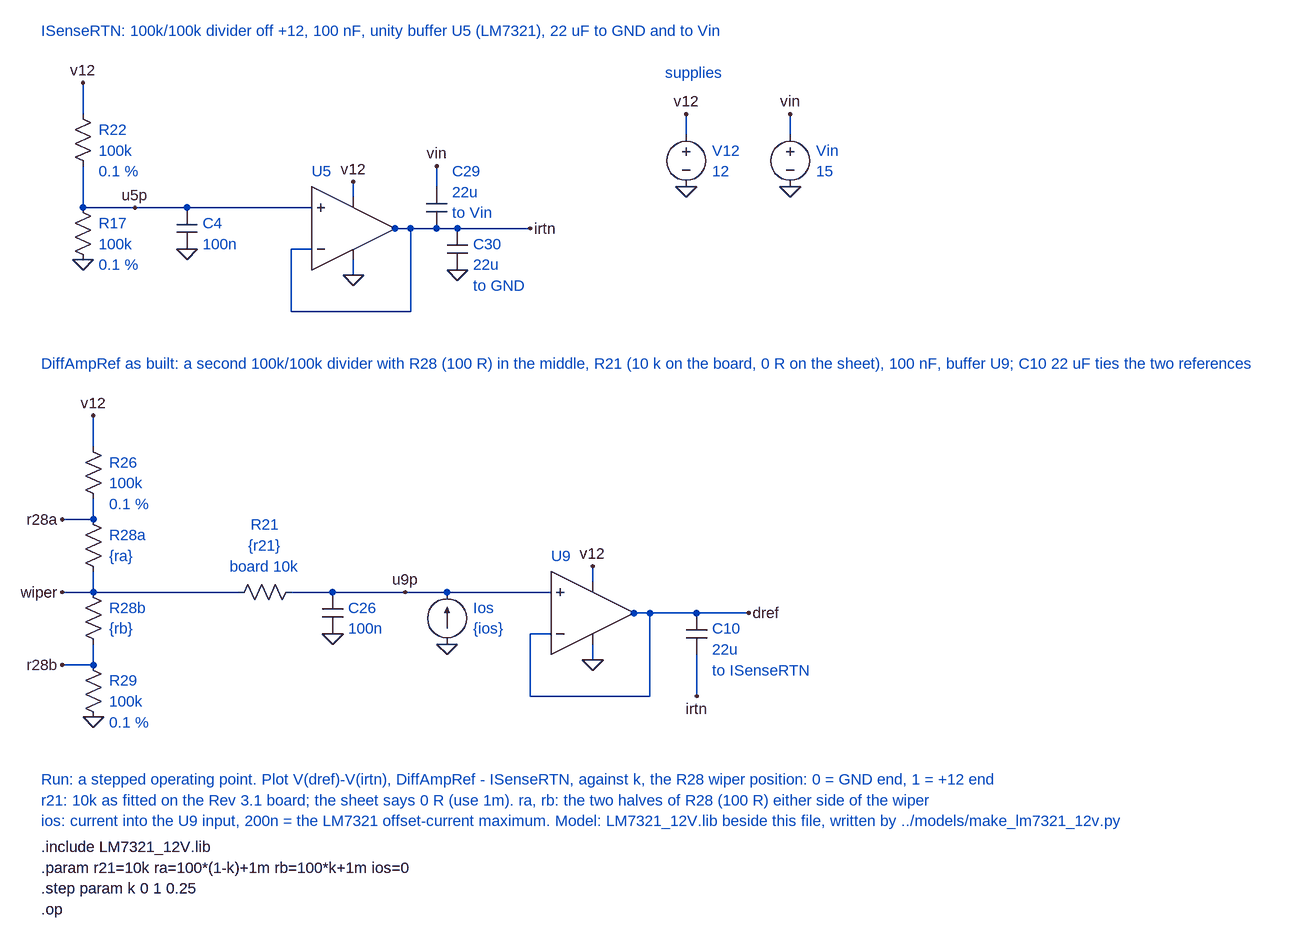
[diagram p0: schematic ref_asbuilt.asc]
ref_asbuilt.asc, the LTspice schematic file:
Version 4
SHEET 1 2400 1500
TEXT 48 96 Left 2 ;ISenseRTN: 100k/100k divider off +12, 100 nF, unity buffer U5 (LM7321), 22 uF to GND and to Vin
WIRE 112 176 112 224
FLAG 112 176 v12
SYMBOL res 96 208 R0
WINDOW 0 0 0 Invisible 2
WINDOW 3 0 0 Invisible 2
SYMATTR InstName R22
SYMATTR Value 100k
TEXT 136 248 Left 2 ;R22
TEXT 136 280 Left 2 ;100k
TEXT 136 312 Left 2 ;0.1 %
WIRE 112 304 112 368
SYMBOL res 96 352 R0
WINDOW 0 0 0 Invisible 2
WINDOW 3 0 0 Invisible 2
SYMATTR InstName R17
SYMATTR Value 100k
TEXT 136 392 Left 2 ;R17
TEXT 136 424 Left 2 ;100k
TEXT 136 456 Left 2 ;0.1 %
FLAG 112 448 0
WIRE 112 368 272 368
WIRE 272 368 464 368
FLAG 192 368 u5p
SYMBOL cap 256 368 R0
WINDOW 0 0 0 Invisible 2
WINDOW 3 0 0 Invisible 2
SYMATTR InstName C4
SYMATTR Value 100n
TEXT 296 392 Left 2 ;C4
TEXT 296 424 Left 2 ;100n
FLAG 272 432 0
SYMBOL LM7321_12V 464 336 R0
WINDOW 0 0 0 Invisible 2
WINDOW 3 0 0 Invisible 2
SYMATTR InstName U5
TEXT 464 312 Left 2 ;U5
WIRE 464 432 432 432
WIRE 432 432 432 528
WIRE 432 528 616 528
WIRE 616 528 616 400
WIRE 616 400 592 400
WIRE 528 352 528 328
FLAG 528 328 v12
WIRE 528 448 528 472
FLAG 528 472 0
WIRE 592 400 656 400
WIRE 656 400 688 400
WIRE 688 400 800 400
FLAG 800 400 irtn
SYMBOL cap 640 336 R0
WINDOW 0 0 0 Invisible 2
WINDOW 3 0 0 Invisible 2
SYMATTR InstName C29
SYMATTR Value 22u
TEXT 680 312 Left 2 ;C29
TEXT 680 344 Left 2 ;22u
TEXT 680 376 Left 2 ;to Vin
WIRE 656 336 656 304
FLAG 656 304 vin
SYMBOL cap 672 400 R0
WINDOW 0 0 0 Invisible 2
WINDOW 3 0 0 Invisible 2
SYMATTR InstName C30
SYMATTR Value 22u
TEXT 712 424 Left 2 ;C30
TEXT 712 456 Left 2 ;22u
TEXT 712 488 Left 2 ;to GND
FLAG 688 464 0
TEXT 1008 160 Left 2 ;supplies
WIRE 1040 224 1040 256
FLAG 1040 224 v12
SYMBOL voltage 1040 240 R0
WINDOW 0 0 0 Invisible 2
WINDOW 3 0 0 Invisible 2
SYMATTR InstName V12
SYMATTR Value 12
TEXT 1080 280 Left 2 ;V12
TEXT 1080 312 Left 2 ;12
FLAG 1040 336 0
WIRE 1200 224 1200 256
FLAG 1200 224 vin
SYMBOL voltage 1200 240 R0
WINDOW 0 0 0 Invisible 2
WINDOW 3 0 0 Invisible 2
SYMATTR InstName Vin
SYMATTR Value 15
TEXT 1240 280 Left 2 ;Vin
TEXT 1240 312 Left 2 ;15
FLAG 1200 336 0
TEXT 48 608 Left 2 ;DiffAmpRef as built: a second 100k/100k divider with R28 (100 R) in the middle, R21 (10 k on the board, 0 R on the sheet), 100 nF, buffer U9; C10 22 uF ties the two references
WIRE 128 688 128 736
FLAG 128 688 v12
SYMBOL res 112 720 R0
WINDOW 0 0 0 Invisible 2
WINDOW 3 0 0 Invisible 2
SYMATTR InstName R26
SYMATTR Value 100k
TEXT 152 760 Left 2 ;R26
TEXT 152 792 Left 2 ;100k
TEXT 152 824 Left 2 ;0.1 %
WIRE 128 816 128 848
WIRE 128 848 80 848
FLAG 80 848 r28a
SYMBOL res 112 832 R0
WINDOW 0 0 0 Invisible 2
WINDOW 3 0 0 Invisible 2
SYMATTR InstName R28a
SYMATTR Value {ra}
TEXT 152 872 Left 2 ;R28a
TEXT 152 904 Left 2 ;{ra}
WIRE 128 928 128 960
WIRE 128 960 80 960
FLAG 80 960 wiper
SYMBOL res 112 944 R0
WINDOW 0 0 0 Invisible 2
WINDOW 3 0 0 Invisible 2
SYMATTR InstName R28b
SYMATTR Value {rb}
TEXT 152 984 Left 2 ;R28b
TEXT 152 1016 Left 2 ;{rb}
WIRE 128 1040 128 1072
WIRE 128 1072 80 1072
FLAG 80 1072 r28b
SYMBOL res 112 1056 R0
WINDOW 0 0 0 Invisible 2
WINDOW 3 0 0 Invisible 2
SYMATTR InstName R29
SYMATTR Value 100k
TEXT 152 1096 Left 2 ;R29
TEXT 152 1128 Left 2 ;100k
TEXT 152 1160 Left 2 ;0.1 %
FLAG 128 1152 0
WIRE 128 960 352 960
SYMBOL res 336 976 R270
WINDOW 0 0 0 Invisible 2
WINDOW 3 0 0 Invisible 2
SYMATTR InstName R21
SYMATTR Value {r21}
TEXT 392 856 Center 2 ;R21
TEXT 392 888 Center 2 ;{r21}
TEXT 392 920 Center 2 ;board 10k
WIRE 432 960 496 960
WIRE 496 960 672 960
WIRE 672 960 832 960
FLAG 608 960 u9p
SYMBOL cap 480 960 R0
WINDOW 0 0 0 Invisible 2
WINDOW 3 0 0 Invisible 2
SYMATTR InstName C26
SYMATTR Value 100n
TEXT 520 984 Left 2 ;C26
TEXT 520 1016 Left 2 ;100n
FLAG 496 1024 0
SYMBOL current 672 1040 R180
WINDOW 0 0 0 Invisible 2
WINDOW 3 0 0 Invisible 2
SYMATTR InstName Ios
SYMATTR Value {ios}
TEXT 712 984 Left 2 ;Ios
TEXT 712 1016 Left 2 ;{ios}
FLAG 672 1040 0
SYMBOL LM7321_12V 832 928 R0
WINDOW 0 0 0 Invisible 2
WINDOW 3 0 0 Invisible 2
SYMATTR InstName U9
TEXT 832 904 Left 2 ;U9
WIRE 832 1024 800 1024
WIRE 800 1024 800 1120
WIRE 800 1120 984 1120
WIRE 984 1120 984 992
WIRE 984 992 960 992
WIRE 896 944 896 920
FLAG 896 920 v12
WIRE 896 1040 896 1064
FLAG 896 1064 0
WIRE 960 992 1056 992
WIRE 1056 992 1136 992
FLAG 1136 992 dref
SYMBOL cap 1040 992 R0
WINDOW 0 0 0 Invisible 2
WINDOW 3 0 0 Invisible 2
SYMATTR InstName C10
SYMATTR Value 22u
TEXT 1080 1016 Left 2 ;C10
TEXT 1080 1048 Left 2 ;22u
TEXT 1080 1080 Left 2 ;to ISenseRTN
WIRE 1056 1056 1056 1120
FLAG 1056 1120 irtn
TEXT 48 1248 Left 2 ;Run: a stepped operating point. Plot V(dref)-V(irtn), DiffAmpRef - ISenseRTN, against k, the R28 wiper position: 0 = GND end, 1 = +12 end
TEXT 48 1280 Left 2 ;r21: 10k as fitted on the Rev 3.1 board; the sheet says 0 R (use 1m). ra, rb: the two halves of R28 (100 R) either side of the wiper
TEXT 48 1312 Left 2 ;ios: current into the U9 input, 200n = the LM7321 offset-current maximum. Model: LM7321_12V.lib beside this file, written by ../models/make_lm7321_12v.py
TEXT 48 1352 Left 2 !.include LM7321_12V.lib
TEXT 48 1384 Left 2 !.param r21=10k ra=100*(1-k)+1m rb=100*k+1m ios=0
TEXT 48 1416 Left 2 !.step param k 0 1 0.25
TEXT 48 1448 Left 2 !.op

The netlist it stands for:
* ref_asbuilt.asc
R22 v12 u5p 100k
R17 u5p 0 100k
C4 u5p 0 100n
XU5 u5p irtn v12 0 irtn LM7321_12V  ; pins IN+ IN- V+ V- OUT
C29 vin irtn 22u
C30 irtn 0 22u
V12 v12 0 12
Vin vin 0 15
R26 v12 r28a 100k
R28a r28a wiper {ra}
R28b wiper r28b {rb}
R29 r28b 0 100k
R21 wiper u9p {r21}
C26 u9p 0 100n
Ios 0 u9p {ios}
XU9 u9p dref v12 0 dref LM7321_12V  ; pins IN+ IN- V+ V- OUT
C10 dref irtn 22u
* ISenseRTN: 100k/100k divider off +12, 100 nF, unity buffer U5 (LM7321), 22 uF to GND and to Vin
* R22
* 100k
* 0.1 %
* R17
* 100k
* 0.1 %
* C4
* 100n
* U5
* C29
* 22u
* to Vin
* C30
* 22u
* to GND
* supplies
* V12
* 12
* Vin
* 15
* DiffAmpRef as built: a second 100k/100k divider with R28 (100 R) in the middle, R21 (10 k on the board, 0 R on the sheet), 100 nF, buffer U9; C10 22 uF ties the two references
* R26
* 100k
* 0.1 %
* R28a
* {ra}
* R28b
* {rb}
* R29
* 100k
* 0.1 %
* R21
* {r21}
* board 10k
* C26
* 100n
* Ios
* {ios}
* U9
* C10
* 22u
* to ISenseRTN
* Run: a stepped operating point. Plot V(dref)-V(irtn), DiffAmpRef - ISenseRTN, against k, the R28 wiper position: 0 = GND end, 1 = +12 end
* r21: 10k as fitted on the Rev 3.1 board; the sheet says 0 R (use 1m). ra, rb: the two halves of R28 (100 R) either side of the wiper
* ios: current into the U9 input, 200n = the LM7321 offset-current maximum. Model: LM7321_12V.lib beside this file, written by ../models/make_lm7321_12v.py
.include LM7321_12V.lib
.param r21=10k ra=100*(1-k)+1m rb=100*k+1m ios=0
.step param k 0 1 0.25
.op
.backanno
.end